# EasyEDA Pro project ProProject_2023新生开发板（小组）_2025-05-30.epro, board PCB1_3
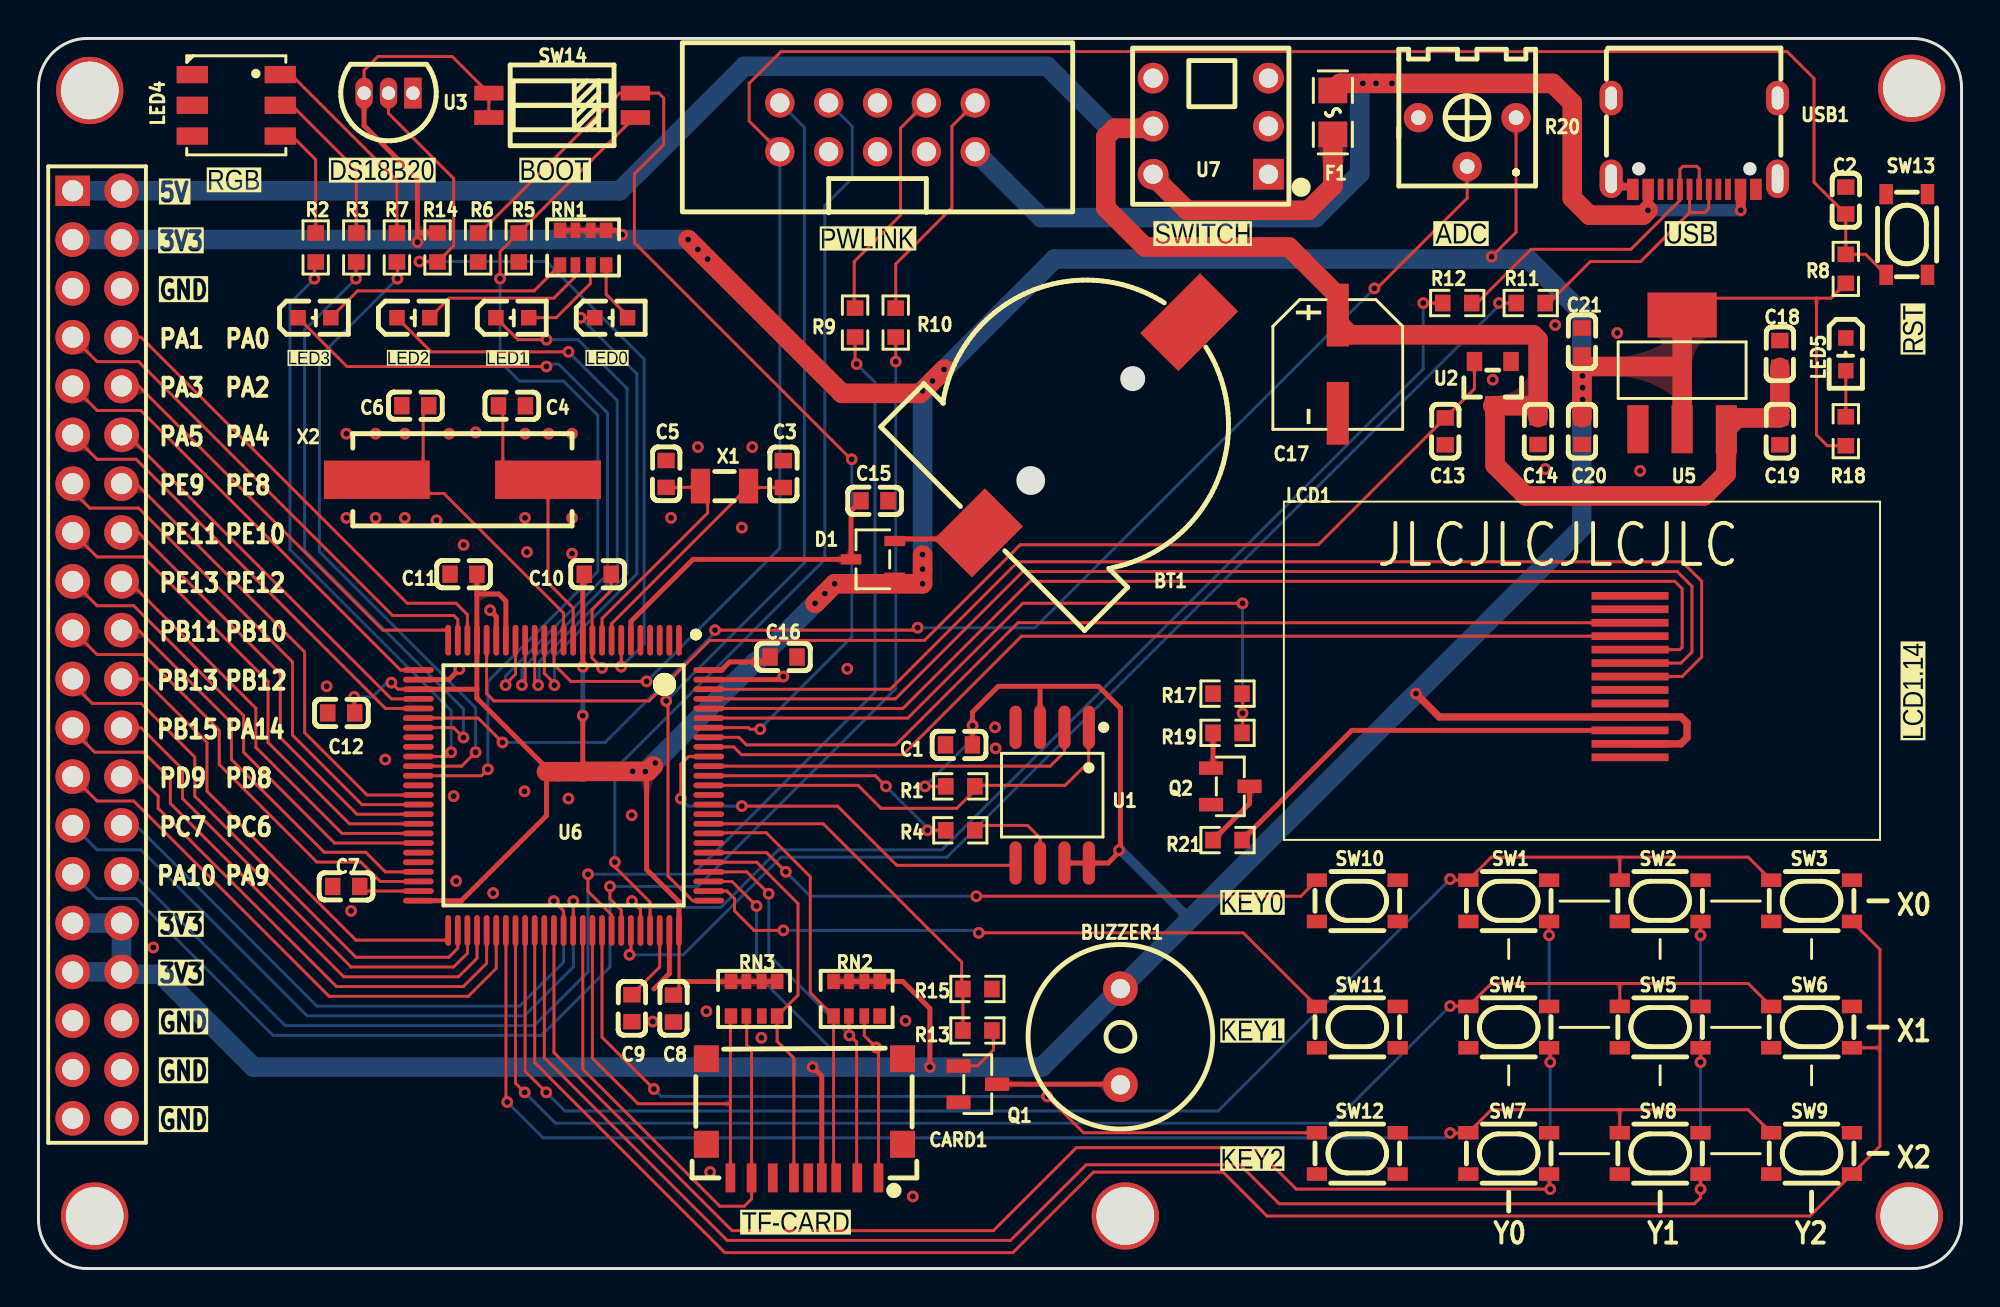
[diagram p2: board, top side]
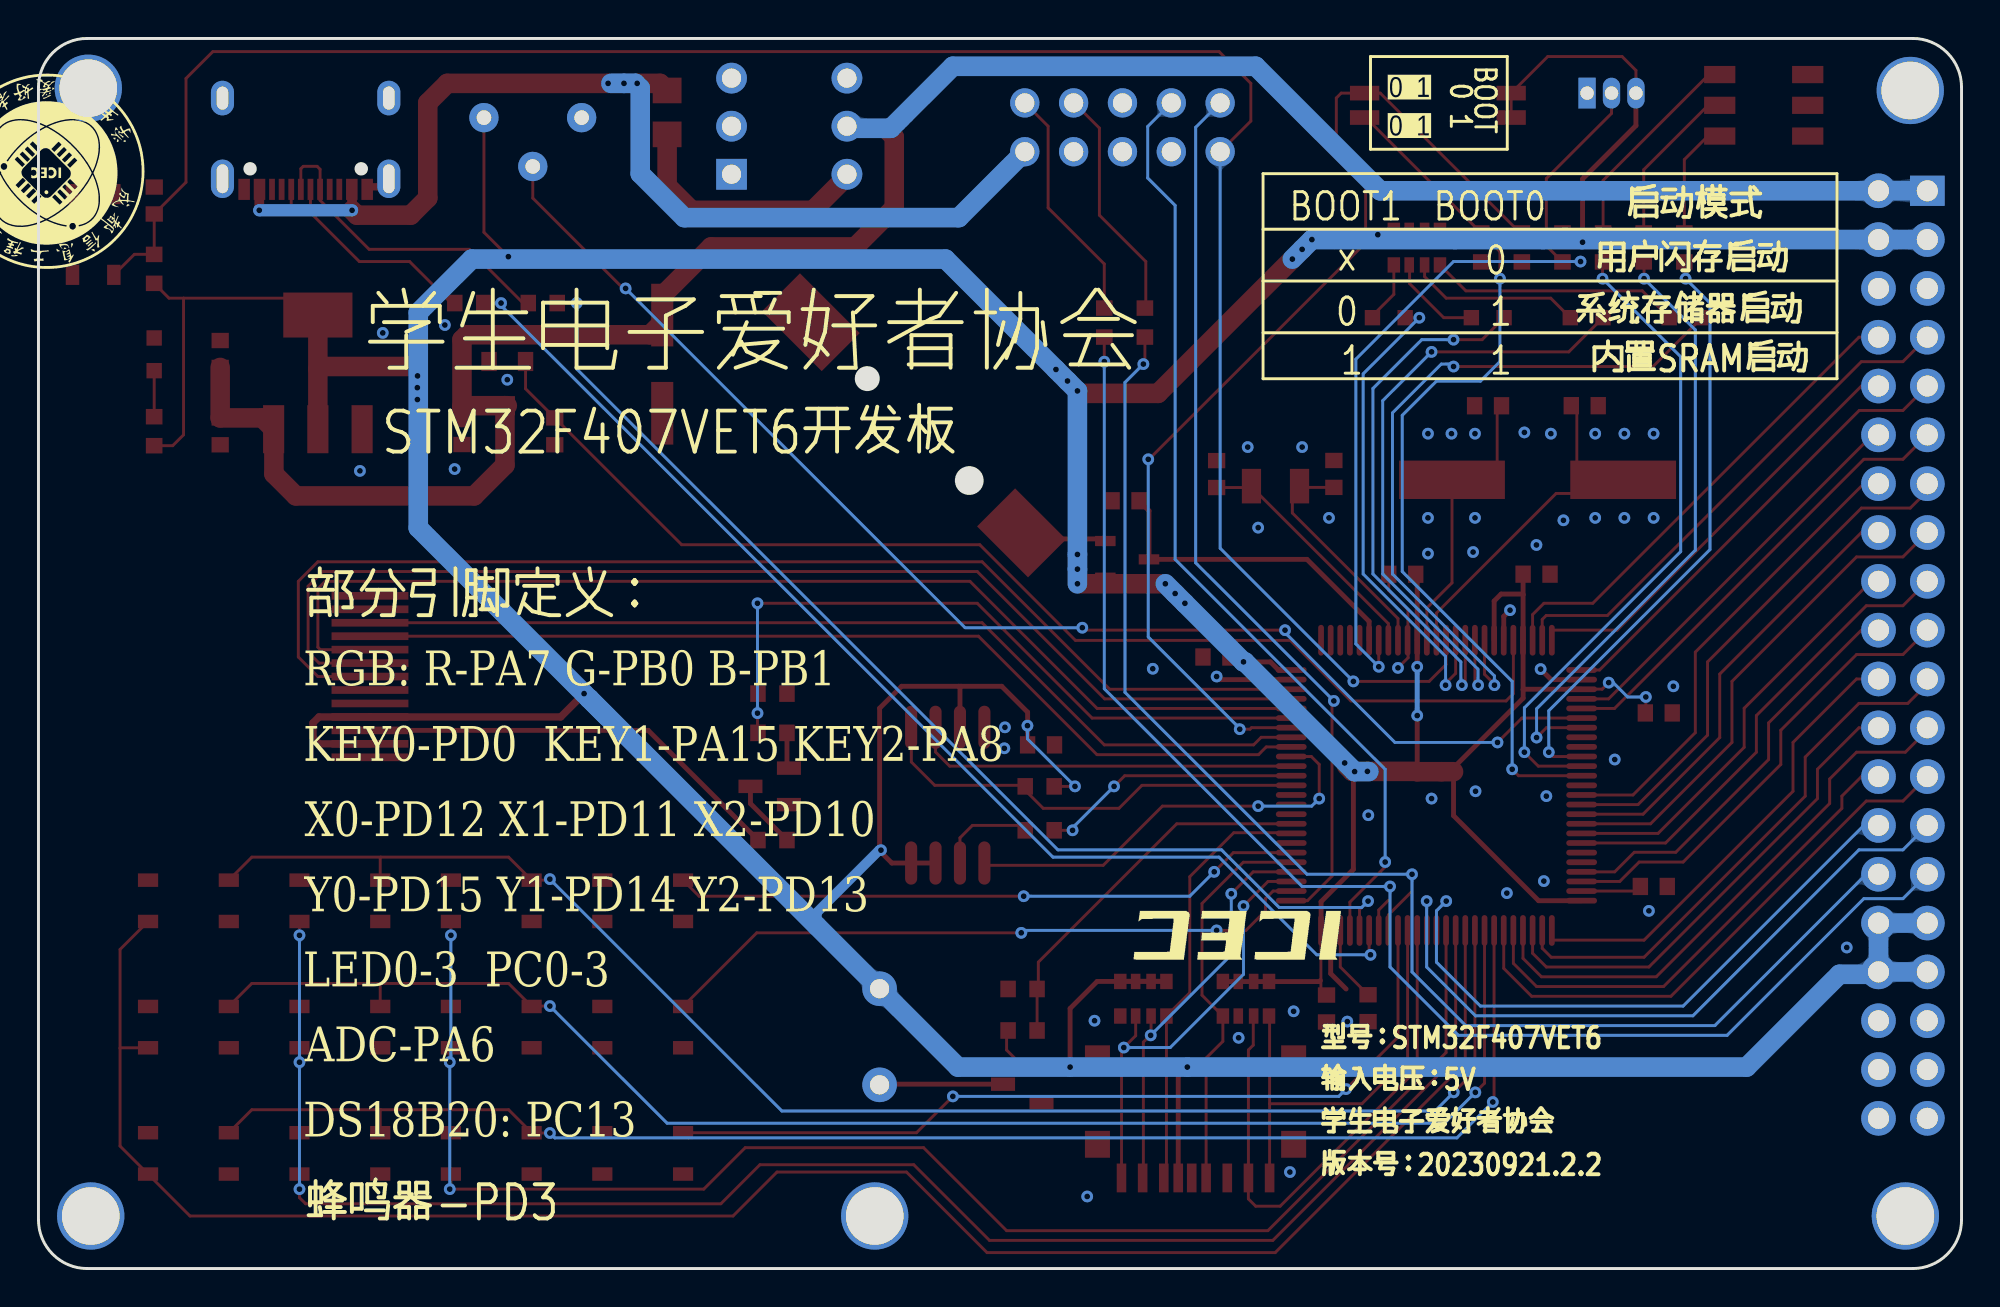
[diagram p3: board, bottom side, seen from below]

Outline 100 x 64 mm; copper layers: Top Layer, Bottom Layer. Coordinates in mm from the lower left corner of the outline.
Outline path: 0,61.46 0,2.54 arc(0.74,0.74) 2.54,0 97.46,0 arc(99.26,0.74) 100,2.54 100,61.46 arc(99.26,63.26) 97.46,64 2.54,64 arc(0.74,63.26) 0,61.46
Stack: Top Layer 0.035mm / Dielectric1 1.51mm FR4 er 4.5 / Bottom Layer 0.035mm

## Design rules (mm)
template: JLCPCB Capability(Two Layers Board)
spacing copperThickness1oz (default): track to track 0.102, other pairs 0.152 to 0.3
spacing copperThickness2oz: track to track 0.203, other pairs 0.152 to 0.3
track width copperThickness1oz (default): min 0.127, default 0.254, max 2.54
track width copperThickness2oz: min 0.203, default 0.254, max 2.54
differential pair differentialPair (default): width min 0.127, default 0.254, max 2.54; gap min 0.152, default 0.152
via viaSize (default): diameter min 0.5, default 0.61, max 10; hole min 0.3, default 0.305, max 6.3

## Placement (name value [footprint] x y rotation side)
BT1  BS-12-B3AA003  [BAT-SMD_BS-12-B3AA011]  54.36 43.76 225 top
BUZZER1  3000Hz  [BUZ-TH_BD9.6-P5.00-D0.7-FD]  56.26 12.06 270 top
C1  100nF  [C0603]  47.86 27.25 180 top
C2  100nF  [C0603]  93.98 55.57 270 top
C3  12pF  [C0603]  38.73 41.33 270 top
C4  20pF  [C0603]  24.62 44.89 0 top
C5  12pF  [C0603]  32.64 41.34 270 top
C6  20pF  [C0603]  19.59 44.89 180 top
C7  1uF  [C0603]  16 19.88 0 top
C8  100nF  [C0603]  33.02 13.53 270 top
C9  1uF  [C0603]  30.86 13.55 90 top
C10  100nF  [C0603]  29.08 36.12 0 top
C11  100nF  [C0603]  22.1 36.13 180 top
C12  100nF  [C0603]  15.74 28.91 180 top
C13  100nF  [C0603]  73.15 43.56 270 top
C14  1uF  [C0603]  77.98 43.57 90 top
C15  100nF  [C0603]  43.47 39.95 180 top
C16  100nF  [C0603]  38.75 31.82 0 top
C17  220uF  [CAP-SMD_BD6.3-L6.6-W6.6-LS7.2-R-RD]  67.56 47.05 90 top
C18  1uF  [C0603]  90.55 47.58 270 top
C19  100nF  [C0603]  90.55 43.56 270 top
C20  1uF  [C0603]  80.26 43.57 90 top
C21  100nF  [C0603]  80.26 48.23 90 top
CARD1  XKTF-0803-0  [TF-SMD_XKTF-0803-0]  39.83 7.81 0 top
D1  BAT54C  [SOT-23-3_L2.9-W1.4-P1.91-LS2.6-BR]  43.39 36.9 0 top
F1  BSMD0805-020-30V  [F0805]  67.31 60.15 90 top
H1  B-2100S40P-B110  [HDR-TH_40P-P2.54-V-M-R2-C20-S2.54]  3.05 31.94 270 top
LCD1  -  [1.14lcd]  80.46 30.8 270 top
LED0  NCD0603R3  [LED0603-R-RD_RED]  29.78 49.47 0 top
LED1  NCD0603R3  [LED0603-R-RD_RED]  24.64 49.47 0 top
LED2  NCD0603R3  [LED0603-R-RD_RED]  19.49 49.47 0 top
LED3  NCD0603R3  [LED0603-R-RD_RED]  14.35 49.47 0 top
LED4  MHP5050RGBDT  [LED-ARRAY-SMD_6P-L5.0-W5.0-TR-RD]  10.29 60.52 0 top
LED5  NCD0603R3  [LED0603-R-RD_RED]  93.98 47.57 270 top
NOREF  -  [Pad_e78]  97.41 61.41 0 top
NOREF#2  -  [Pad_e77]  97.28 2.73 0 top
NOREF#3  -  [Pad_e103]  56.52 2.73 0 top
NOREF#4  -  [Pad_e76]  2.92 2.73 0 top
NOREF#5  -  [Pad_e73]  2.67 61.29 0 top
P1  2.54-2*5P简牛  [IDC-TH_10P-P2.54_C5665]  43.63 59.38 0 top
Q1  SS8050  [SOT-23-3_L2.9-W1.3-P1.90-LS2.4-BR]  48.84 9.59 180 top
Q2  SS8050  [SOT-23-3_L2.9-W1.3-P1.90-LS2.4-BR]  61.98 25.09 180 top
R1  10kΩ  [R0603]  47.94 25.09 0 top
R2  220Ω  [R0603]  14.41 53.13 90 top
R3  220Ω  [R0603]  16.53 53.13 90 top
R4  20Ω  [R0603]  47.94 22.8 180 top
R5  10kΩ  [R0603]  24.98 53.13 270 top
R6  10kΩ  [R0603]  22.86 53.13 270 top
R7  470Ω  [R0603]  18.64 53.13 90 top
R8  10kΩ  [R0603]  93.98 52.01 90 top
R9  20Ω  [R0603]  42.46 49.22 270 top
R10  20Ω  [R0603]  44.58 49.22 90 top
R11  20Ω  [R0603]  77.6 50.23 0 top
R12  20Ω  [R0603]  73.78 50.23 0 top
R13  4.7kΩ  [R0603]  48.83 12.39 180 top
R14  10K  [R0603]  20.75 53.13 90 top
R15  10kΩ  [R0603]  48.83 14.55 180 top
R17  100kΩ  [R0603]  61.83 29.91 180 top
R18  470Ω  [R0603]  93.98 43.57 90 top
R19  1kΩ  [R0603]  61.83 27.87 180 top
R20  10kΩ  [RES-ADJ-TH_3362P]  74.3 58.61 180 top
R21  20Ω  [R0603]  61.83 22.29 180 top
RN1  470Ω  [RES-ARRAY-SMD_0603-8P-L3.2-W1.6-BL]  28.32 53.12 0 top
RN2  10kΩ  [RES-ARRAY-SMD_0603-8P-L3.2-W1.6-BL]  42.55 14.04 180 top
RN3  10kΩ  [RES-ARRAY-SMD_0603-8P-L3.2-W1.6-BL]  37.21 14.04 180 top
SW1  SKRPACE010  [KEY-SMD_4P-L4.2-W3.2-P2.20-LS4.6]  76.45 19.13 0 top
SW2  SKRPACE010  [KEY-SMD_4P-L4.2-W3.2-P2.20-LS4.6]  84.33 19.13 0 top
SW3  SKRPACE010  [KEY-SMD_4P-L4.2-W3.2-P2.20-LS4.6]  92.2 19.13 0 top
SW4  SKRPACE010  [KEY-SMD_4P-L4.2-W3.2-P2.20-LS4.6]  76.45 12.56 0 top
SW5  SKRPACE010  [KEY-SMD_4P-L4.2-W3.2-P2.20-LS4.6]  84.33 12.56 0 top
SW6  SKRPACE010  [KEY-SMD_4P-L4.2-W3.2-P2.20-LS4.6]  92.2 12.56 0 top
SW7  SKRPACE010  [KEY-SMD_4P-L4.2-W3.2-P2.20-LS4.6]  76.45 5.99 0 top
SW8  SKRPACE010  [KEY-SMD_4P-L4.2-W3.2-P2.20-LS4.6]  84.33 5.99 0 top
SW9  SKRPACE010  [KEY-SMD_4P-L4.2-W3.2-P2.20-LS4.6]  92.2 5.99 0 top
SW10  SKRPACE010  [KEY-SMD_4P-L4.2-W3.2-P2.20-LS4.6]  68.58 19.13 0 top
SW11  SKRPACE010  [KEY-SMD_4P-L4.2-W3.2-P2.20-LS4.6]  68.58 12.56 0 top
SW12  SKRPACE010  [KEY-SMD_4P-L4.2-W3.2-P2.20-LS4.6]  68.58 5.99 0 top
SW13  SKRPACE010  [KEY-SMD_4P-L4.2-W3.2-P2.20-LS4.6]  97.15 53.8 90 top
SW14  DSHP02TSGET  [SW-SMD_4P_DSHP02TSGET]  27.23 60.52 90 top
U1  W25Q16JVSSIQ  [SOIC-8_L5.3-W5.3-P1.27-LS8.0-BL]  52.72 24.63 180 top
U2  PJ75AL33SA  [SOT-23_L2.9-W1.3-P1.90-LS2.4-BR]  75.62 46.04 90 top
U3  DS18B20  [TO-92-3_L4.9-W3.7-P1.27-L]  18.2 61.15 180 top
U5  AMS1117-3.3  [SOT-223-3_L6.5-W3.4-P2.30-LS7.0-BR]  85.47 46.64 270 top
U6  STM32F407VET6  [LQFP-100_L14.0-W14.0-P0.50-LS16.0-BL]  27.3 25.14 180 top
U7  PB-22E08  [SW-TH_6P-L8.0-W8.0-P2.50_PB-22E08]  60.96 59.43 90 top
USB1  TYPE-C 16PIN 2MD(073)  [USB-C-SMD_TYPE-C-6PIN-2MD-073]  86.11 58.52 180 top
X1  32.768kHz  [FC-135R_L3.2-W1.5]  35.67 40.71 0 top
X2  8MHz  [CRYSTAL-SMD_L11.5-W4.8-LS12.7]  22.05 41.04 180 top

## Footprints (pads in the part's own frame, mm; a bottom-side part is the same pattern mirrored in y, then rotated)
1.14lcd
  custom 0.4x4 smd: 1(-4.199,2.3) 2(-3.498,2.3) 3(-2.799,2.3) 4(-2.099,2.3) 5(-1.399,2.3) 6(-0.699,2.3) 7(0.002,2.3) 8(0.702,2.3) 9(1.401,2.3) 10(2.102,2.3) 11(2.801,2.3) 12(3.502,2.3) 13(4.202,2.3)
BAT-SMD_BS-12-B3AA011
  rect 3.75x2.8 smd: 1(7.75,0)
  rect 4.4x2.8 smd: 2(-7.75,0)
BUZ-TH_BD9.6-P5.00-D0.7-FD
  round 1.8 hole 1: 1(-2.5,0) 2(2.5,0)
C0603
  rect 0.8x0.9 smd: 1(-0.7,0) 2(0.7,0)
CAP-SMD_BD6.3-L6.6-W6.6-LS7.2-R-RD
  rect 3.26x1.15 smd: 1(2.555,0) 2(-2.555,0)
CRYSTAL-SMD_L11.5-W4.8-LS12.7
  rect 5.5x2 smd: 1(-4.45,0) 2(4.45,0)
F0805
  rect 1.335x1.5 smd: 1(-1.143,0) 2(1.143,0)
FC-135R_L3.2-W1.5
  rect 1x1.8 smd: 1(-1.25,0) 2(1.25,0)
HDR-TH_40P-P2.54-V-M-R2-C20-S2.54
  rect 1.575x1.8 hole 1.1: 1(-24.13,-1.27)
  round 1.8 hole 1.1: 2(-24.13,1.27) 3(-21.59,-1.27) 4(-21.59,1.27) 5(-19.05,-1.27) 6(-19.05,1.27) 7(-16.51,-1.27) 8(-16.51,1.27) 9(-13.97,-1.27) 10(-13.97,1.27) 11(-11.43,-1.27) 12(-11.43,1.27) 13(-8.89,-1.27) 14(-8.89,1.27) 15(-6.35,-1.27) 16(-6.35,1.27) 17(-3.81,-1.27) 18(-3.81,1.27) 19(-1.27,-1.27) 20(-1.27,1.27) 21(1.27,-1.27) 22(1.27,1.27) 23(3.81,-1.27) 24(3.81,1.27) 25(6.35,-1.27) 26(6.35,1.27) 27(8.89,-1.27) 28(8.89,1.27) 29(11.43,-1.27) 30(11.43,1.27) 31(13.97,-1.27) 32(13.97,1.27) 33(16.51,-1.27) 34(16.51,1.27) 35(19.05,-1.27) 36(19.05,1.27) 37(21.59,-1.27) 38(21.59,1.27) 39(24.13,-1.27) 40(24.13,1.27)
IDC-TH_10P-P2.54_C5665
  round 1.524 hole 1: 1(-5.08,-1.27) 2(-5.08,1.27) 3(-2.54,-1.27) 4(-2.54,1.27) 5(0,-1.27) 6(0,1.27) 7(2.54,-1.27) 8(2.54,1.27) 9(5.08,-1.27) 10(5.08,1.27)
KEY-SMD_4P-L4.2-W3.2-P2.20-LS4.6
  rect 1.05x0.7 smd: 1(-2.1,1.075) 2(2.1,1.075) 3(-2.1,-1.075) 4(2.1,-1.075)
LED0603-R-RD_RED
  rect 0.8x0.8 smd: 1(0.851,0) 2(-0.851,0)
LED-ARRAY-SMD_6P-L5.0-W5.0-TR-RD
  rect 1.625x0.896 smd: 1(2.288,1.6) 2(-2.288,1.6) 3(2.288,0) 4(-2.288,0) 5(2.288,-1.6) 6(-2.288,-1.6)
LQFP-100_L14.0-W14.0-P0.50-LS16.0-BL
  oval 0.3x1.6 smd: 1(-6,-7.55) 2(-5.5,-7.55) 3(-5,-7.55) 4(-4.5,-7.55) 5(-4,-7.55) 6(-3.5,-7.55) 7(-3,-7.55) 8(-2.5,-7.55) 9(-2,-7.55) 10(-1.5,-7.55) 11(-1,-7.55) 12(-0.5,-7.55) 13(0,-7.55) 14(0.5,-7.55) 15(1,-7.55) 16(1.5,-7.55) 17(2,-7.55) 18(2.5,-7.55) 19(3,-7.55) 20(3.5,-7.55) 21(4,-7.55) 22(4.5,-7.55) 23(5,-7.55) 24(5.5,-7.55) 25(6,-7.55) 51(6,7.55) 52(5.5,7.55) 53(5,7.55) 54(4.5,7.55) 55(4,7.55) 56(3.5,7.55) 57(3,7.55) 58(2.5,7.55) 59(2,7.55) 60(1.5,7.55) 61(1,7.55) 62(0.5,7.55) 63(0,7.55) 64(-0.5,7.55) 65(-1,7.55) 66(-1.5,7.55) 67(-2,7.55) 68(-2.5,7.55) 69(-3,7.55) 70(-3.5,7.55) 71(-4,7.55) 72(-4.5,7.55) 73(-5,7.55) 74(-5.5,7.55) 75(-6,7.55)
  oval 1.6x0.3 smd: 26(7.55,-6) 27(7.55,-5.5) 28(7.55,-5) 29(7.55,-4.5) 30(7.55,-4) 31(7.55,-3.5) 32(7.55,-3) 33(7.55,-2.5) 34(7.55,-2) 35(7.55,-1.5) 36(7.55,-1) 37(7.55,-0.5) 38(7.55,0) 39(7.55,0.5) 40(7.55,1) 41(7.55,1.5) 42(7.55,2) 43(7.55,2.5) 44(7.55,3) 45(7.55,3.5) 46(7.55,4) 47(7.55,4.5) 48(7.55,5) 49(7.55,5.5) 50(7.55,6) 76(-7.55,6) 77(-7.55,5.5) 78(-7.55,5) 79(-7.55,4.5) 80(-7.55,4) 81(-7.55,3.5) 82(-7.55,3) 83(-7.55,2.5) 84(-7.55,2) 85(-7.55,1.5) 86(-7.55,1) 87(-7.55,0.5) 88(-7.55,0) 89(-7.55,-0.5) 90(-7.55,-1) 91(-7.55,-1.5) 92(-7.55,-2) 93(-7.55,-2.5) 94(-7.55,-3) 95(-7.55,-3.5) 96(-7.55,-4) 97(-7.55,-4.5) 98(-7.55,-5) 99(-7.55,-5.5) 100(-7.55,-6)
Pad_e73
  round 3.5 hole 3: NC(0,0)
Pad_e76
  round 3.5 hole 3: NC(0,0)
Pad_e77
  round 3.5 hole 3: NC(0,0)
Pad_e78
  round 3.5 hole 3: NC(0,0)
Pad_e103
  round 3.5 hole 3: NC(0,0)
R0603
  rect 0.806x0.864 smd: 1(-0.753,0) 2(0.753,0)
RES-ADJ-TH_3362P
  round 1.524 hole 0.762: 1(-2.54,-1.27) 2(0,1.27) 3(2.54,-1.27)
RES-ARRAY-SMD_0603-8P-L3.2-W1.6-BL
  rect 0.65x0.8 smd: 1(-1.2,-0.9) 4(1.2,-0.9) 5(1.2,0.9) 8(-1.2,0.9)
  rect 0.5x0.8 smd: 2(-0.4,-0.9) 3(0.4,-0.9) 6(0.4,0.9) 7(-0.4,0.9)
SOIC-8_L5.3-W5.3-P1.27-LS8.0-BL
  oval 0.63x2.25 smd: 1(-1.905,-3.53) 2(-0.635,-3.53) 3(0.635,-3.53) 4(1.905,-3.53) 5(1.905,3.53) 6(0.635,3.53) 7(-0.635,3.53) 8(-1.905,3.53)
SOT-23-3_L2.9-W1.3-P1.90-LS2.4-BR
  rect 1.25x0.7 smd: 1(1,-0.95) 2(1,0.95) 3(-1,0)
SOT-23-3_L2.9-W1.4-P1.91-LS2.6-BR
  rect 1.07x0.532 smd: 1(1.135,-0.955) 2(1.135,0.955) 3(-1.135,0)
SOT-23_L2.9-W1.3-P1.90-LS2.4-BR
  rect 1x0.8 smd: 1(1.15,-0.95) 2(1.15,0.95) 3(-1.15,0)
SOT-223-3_L6.5-W3.4-P2.30-LS7.0-BR
  rect 2.5x1.1 smd: 1(2.97,-2.3) 2(2.97,0) 3(2.97,2.3)
  rect 2.34x3.6 smd: 4(-2.97,0)
SW-SMD_4P_DSHP02TSGET
  rect 0.762x1.524 smd: 1(-0.635,-3.81) 2(0.635,-3.81) 3(0.635,3.81) 4(-0.635,3.81)
SW-TH_6P-L8.0-W8.0-P2.50_PB-22E08
  rect 1.6x1.6 hole 1: 1(-2.5,-3)
  round 1.6 hole 1: 2(0,-3) 3(2.5,-3) 4(-2.5,3) 5(0,3) 6(2.5,3)
TF-SMD_XKTF-0803-0
  rect 0.5x1.5 smd: 1(3.85,-3.1) 2(2.75,-3.1) 3(1.65,-3.1) 4(0.9,-3.1) 5(-0.55,-3.1) 6(-1.65,-3.1) 7(-2.75,-3.1) 8(-3.85,-3.1) 9(0.2,-3.1)
  rect 1.3x1.4 smd: 10(-5.1,-1.35) 11(-5.1,3.1) 12(5.1,3.1) 13(5.1,-1.35)
TO-92-3_L4.9-W3.7-P1.27-L
  rect 0.9x1.6 hole 0.7: 1(-1.27,0)
  oval 0.9x1.6 hole 0.7: 2(0,0) 3(1.27,0)
USB-C-SMD_TYPE-C-6PIN-2MD-073
  rect 0.6x1.1 smd: 1(-3.2,2.375) 2(-2.4,2.375) 11(2.4,2.375) 12(3.2,2.375)
  rect 0.3x1.1 smd: 3(-1.75,2.375) 4(-1.25,2.375) 5(-0.75,2.375) 6(-0.25,2.375) 7(0.25,2.375) 8(0.75,2.375) 9(1.25,2.375) 10(1.75,2.375)
  oval 1.2x2 hole 0.6x1.5: 13(-4.325,1.825) 14(4.325,1.825)
  oval 1.2x1.8 hole 0.6x1.2: 13(-4.325,-2.375) 14(4.325,-2.375)

## Nets
As in the schematic.

Pads without a net: CARD1 9; LCD1 1 2 9; NOREF NC; NOREF#2 NC; NOREF#3 NC; NOREF#4 NC; NOREF#5 NC; P1 3 7; RN2 8; RN3 7; SW1 2 3; SW2 2 3; SW3 2 3; SW4 2 3; SW5 2 3; SW6 2 3; SW7 2 3; SW8 2 3; SW9 2 3; SW10 2 3; SW11 2 3; SW12 2 3; SW13 2 3; U6 1 2 3 4 5 33 34 38 45 46 82 85 86 87; U7 1 2 3 6; USB1 3 4 9 10

## Via types
v1: diameter 0.61, hole 0.305, Top Layer to Bottom Layer, 151 vias

## Routing (per net, layer and track width the routed paths; a pad name or vN(x,y) marks a point on that pad's centre or on a via; arc(x,y) is an arc through that point)
3V3: length 441.9
  Top Layer w0.152: U6.11 28.3,35.23 ; U5.4 86.35,50.49 92.46,50.49 ; 92.46,50.49 92.46,43.37 93.02,42.81 R18.1 ; 92.46,50.49 93.21,50.49 R8.1 ; v1(16.42,29.74) 16.42,29.26 16.32,29.16 ; U3.3 16.93,62.34 17.65,63.06 21.52,63.06 SW14.3 SW14.4 ; v1(18.35,30.48) 18.69,30.14 19.48,30.14 19.52,30.1 ; 33.27,17.21 33.31,17.17 33.31,14.52 C8.1 ; v1(75.56,52.65) 76.83,53.92 76.83,59.76 ; R1.1 v1(46.1,25.09)
  Top Layer w0.254: U1.7 U1.8 55.63,21.1 56.26,21.73 56.26,29.15 55.12,30.29 52.14,30.29 ; 22.8,32.7 U6.22 ; 22.8,32.7 22.8,30.14 22.76,30.14 ; 22.8,32.7 22.8,35.06 ; 27.05,25.85 27.18,25.72 28.3,25.72 v1(28.3,28.77) ; U1.3 52.08,30.23 ; 52.08,30.23 52.14,30.29 ; 52.08,30.23 52.08,30.24 52.03,30.29 ; 22.76,30.14 22.8,30.1 22.8,29.67 26.42,26.05 26.42,23.56 21.99,19.14 U6.50 ; 22.76,30.14 U6.28 ; v1(30.35,53.79) 30.13,54.02 RN1.5 RN1.7 RN1.8 ; 38.57,14.93 33.39,14.93 33.34,14.99 ; 52.14,30.29 52.03,30.29 ; v1(40.26,10.48) 40.73,10.01 CARD1.4 40.8,4.64 40.8,4.42 ; 41.42,14.95 43.81,14.95 43.83,14.96 ; 22.8,35.06 22.83,35.09 23.94,35.09 24.3,34.73 U6.19 ; 22.8,35.06 C11.1 ; U6.75 33.3,19.09 31.62,20.77 31.62,25.68 31.52,25.78 ; 52.03,30.29 49.91,30.29 48.56,28.95 C1.1 ; C16.1 37.79,31.56 v1(37.34,31.56) 35.94,31.56 35.52,31.14 35.22,31.14 ; v1(19.71,53.4) 19.71,53.89 ; 19.71,53.89 19.71,56.69 16.93,59.46 U3.3 ; 19.71,53.89 19.72,53.88 R14.2 ; v1(46.36,10.48) 46.36,13.53 44.95,14.94 RN2.1 RN2.2 RN2.3 41.34,14.94 ; C10.1 28.3,36.04 U6.11 v1(28.3,31.31)
  Top Layer w0.381: v1(71.63,29.91) 72.84,28.7 LCD1.10 85.41,28.7 85.73,28.39 85.73,27.63 85.4,27.3 LCD1.12
  Top Layer w1.016: U5.2 85.47,46.81 ; 85.47,46.81 U5.4 ; 85.47,46.81 85.35,46.93 80.3,46.93 80.26,46.9 C20.2 ; 26.42,25.85 28.3,25.85 28.32,25.87 v1(30.89,25.87) 31.69,25.87 31.97,26.15 ; v1(33.78,53.53) v1(34.29,53.03) v1(34.8,52.52) 41.78,45.53 45.85,45.53 v1(46.49,46.18) 47.12,46.8 ; 45.97,37.12 v1(45.97,36.39) v1(45.97,35.63) v1(41.4,35.63) v1(40.89,35.12) v1(40.39,34.61)
  Bottom Layer w0.152: v1(18.35,30.48) 18.11,30.48 17.36,29.74 v1(16.42,29.74) ; 21.82,53.41 21.76,53.46 21.76,53.53 ; v1(46.1,25.09) 48.57,27.56 v1(48.57,28.25)
  Bottom Layer w0.254: v1(19.71,53.4) 19.72,53.42 19.72,53.53 ; v1(30.35,53.79) 26.58,53.79 26.33,53.53 ; 70.43,28.71 70.44,28.7 70.48,28.7 ; v1(28.3,28.77) v1(28.3,31.31)
  Bottom Layer w0.508: 59.53,17.82 59.53,18.52 56.28,21.77 v1(56.19,21.77)
  Bottom Layer w1.016: v1(45.97,35.63) v1(45.97,36.39) v1(45.97,37.15) v1(45.97,45.66) v1(46.49,46.18) v1(47.09,46.78) 52.83,52.52 77.47,52.52 80.25,49.74 80.25,38.53 v1(71.63,29.91) 71.37,29.65 ; 71.37,29.65 70.43,28.71 ; 71.37,29.65 71.36,29.65 BUZZER1.1 52.18,10.48 v1(46.36,10.48) v1(40.26,10.48) 11.18,10.48 6.35,15.31 4.44,15.31 H1.34 ; H1.34 H1.32 H1.31 ; H1.34 H1.33 ; v1(34.8,52.52) v1(34.29,53.03) v1(33.78,53.53) H1.4 H1.3 ; 30.82,25.86 v1(31.56,25.86) 37.27,31.56 v1(37.34,31.56) v1(40.39,34.61) v1(40.89,35.12) v1(41.4,35.63)
  vias: v1(32.08,26.3) v1(80.29,46.44) v1(80.3,45.83) v1(80.3,45.21)
+5V: length 123.3
  Top Layer w1.016: 75.74,44.89 77.94,44.89 77.98,44.85 ; 75.74,44.89 U2.3 ; 75.74,44.89 75.74,41.8 77.34,40.2 86.61,40.2 87.76,41.34 87.76,43.66 U5.3 88.36,44.26 C19.1 C18.2 ; 77.98,44.85 77.98,48.33 77.72,48.58 68.2,48.58 67.56,49.22 C17.1 67.56,50.61 65.02,53.15 57.53,53.15 55.5,55.19 55.5,58.87 55.96,59.33 57.96,59.33 ; 77.98,44.85 C14.2
  Bottom Layer w1.016: H1.1 H1.2 30.23,56.07 36.7,62.55 52.45,62.55 55.68,59.33 57.96,59.33
GND: length 17.3
  Top Layer w0.152: 20.1,30.64 U6.27 ; 28.78,32.29 28.78,31.78 v1(29.3,31.25) ; 29.78,35.88 29.78,35.27 28.79,34.28 28.79,32.99
  Top Layer w0.254: v1(38.73,30.8) 38.57,30.64 U6.99 ; U6.74 32.8,15.35 32,14.55 ; U6.20 23.8,33.93 v1(23.48,34.25) ; v1(21.89,31.19) 21.34,30.64 20.1,30.64
  Top Layer w0.381: 81.78,56.83 82.33,56.28 82.91,56.28
  vias: v1(5.97,16.7) v1(14.99,30.29) v1(16.01,43.44) v1(16.01,39.06) v1(16.26,18.61) v1(17.53,43.44) v1(17.53,39.06) v1(18.03,26.48) v1(19.05,43.44) v1(19.05,39.06) v1(20.7,38.93) v1(21.35,43.44) v1(21.59,24.58) v1(21.72,20.16) v1(22.11,37.65) v1(22.73,43.5) v1(23.64,19.53) v1(25.3,43.44) v1(25.3,39.06) v1(25.27,24.83) v1(25.4,37.28) v1(26.52,43.44) v1(27.56,24.45) v1(27.75,43.44) v1(27.75,39.06) v1(27.75,37.2) v1(30.85,23.59) v1(31.94,12.85) v1(32.89,39.06) v1(34.29,42.74) v1(34.73,13.38) v1(34.92,5.02) v1(36.58,38.55) v1(37.12,42.74) v1(37.59,12.01) v1(42.06,31.21) v1(45.08,12.89) v1(45.47,3.75) v1(49.74,28.16) v1(49.77,27.07) v1(75.62,46.24) v1(78.36,41.6) v1(78.87,49.09) v1(82.1,48.68) v1(83.28,41.5)
VBAT: length 17
  Top Layer w0.254: C15.2 42.25,39.43 D1.3 34.04,36.9 30.8,33.67 U6.6
VIN: length 58.1
  Top Layer w0.508: 88.51,56.28 88.52,56.27 v1(88.52,55.06) ; 83.71,56.28 83.69,56.27 v1(83.69,55.06)
  Top Layer w1.016: F1.2 67.68,61.66 v1(68.87,61.66) v1(69.55,61.66) v1(70.38,61.66) 78.74,61.66 79.76,60.65 79.76,55.69 80.64,54.8 83.44,54.8 v1(83.69,55.06)
  Bottom Layer w0.635: v1(88.52,55.06) v1(83.69,55.06)
  Bottom Layer w1.016: P1.9 52.14,54.68 66.42,54.68 68.71,56.96 68.71,61.41 68.96,61.66 v1(69.55,61.66) 70.23,61.66
ADC_RES: length 68.8
  Top Layer w0.152: v1(45.72,33.34) 45.59,33.21 v1(35.18,33.21) ; 74.3,57.59 74.3,55.69 69.6,50.99 v1(69.47,50.99) ; v1(24.13,27.37) 22.86,28.64 U6.31
  Bottom Layer w0.152: v1(69.47,50.99) 51.82,33.34 v1(45.72,33.34) ; v1(24.13,27.37) 29.46,27.37 35.18,33.09 v1(35.18,33.21)
BOOT0: length 55.6
  Top Layer w0.152: v1(42.29,42.1) 42.25,42.1 30.99,53.37 30.99,56.96 32.51,58.49 32.51,60.9 32.26,61.15 SW14.2 30.23,61.15 22.95,53.88 R6.1 ; v1(37.53,28.06) 37,28.06 36.92,28.14 U6.94
  Bottom Layer w0.152: v1(37.53,28.06) 37.53,28.1 42.29,32.86 v1(42.29,42.1)
BOOT1: length 46.4
  Top Layer w0.152: U6.37 23.03,25.64 v1(23.37,25.98) ; v1(24,51.5) 24,52.91 R5.1 30.98,59.88 SW14.1
  Bottom Layer w0.152: v1(24,51.5) 24,47.18 25.02,46.17 27.3,46.17 29.08,44.39 29.08,36.26 23.37,30.55 v1(23.37,25.98)
BUZZER: length 19.7
  Top Layer w0.152: U6.84 40.81,23.14 48.01,15.94 48.01,14.61 R15.2 R13.2
DS18B20: length 43.1
  Top Layer w0.152: U6.7 v1(30.3,31.31) ; v1(19.81,52.39) 20.73,52.39 R14.1 21.59,53.21 21.59,56.71 18.2,60.1 U3.2
  Bottom Layer w0.152: v1(30.3,31.31) 31.5,32.5 31.5,47.31 26.42,52.39 v1(19.81,52.39)
FLASH_CS: length 23.1
  Top Layer w0.152: U6.88 42.62,25.14 43.81,23.94 47.75,23.94 48.95,25.14 53.39,25.14 54.61,26.36 54.61,28.15 U1.1
KEY0: length 32.9
  Top Layer w0.152: v1(48.77,19.37) 65.64,19.37 SW10.1 ; U6.81 37.86,21.64 v1(38.86,20.64)
  Bottom Layer w0.152: v1(38.86,20.64) 40.13,19.37 v1(48.77,19.37)
KEY1: length 34.5
  Top Layer w0.152: SW11.1 62.65,17.47 v1(48.89,17.47) ; v1(38.73,17.59) 37.21,17.59 36.2,18.61 36.2,19.24 35.8,19.64 U6.77
  Bottom Layer w0.152: v1(48.89,17.47) 48.77,17.59 v1(38.73,17.59)
KEY2: length 45.2
  Top Layer w0.152: v1(32,9.34) 29.3,12.04 U6.67 ; 66.21,6.8 SW12.1 54.34,7.07 v1(52.45,8.96)
  Bottom Layer w0.152: v1(52.45,8.96) 32.39,8.96 v1(32,9.34)
KEY_X0: length 80.2
  Top Layer w0.152: 82.2,21.4 88.91,21.4 SW3.1 ; 82.2,21.4 75.55,21.4 SW1.1 73.46,20.21 v1(73.41,20.26) ; 82.2,21.4 82.23,21.38 SW2.1 ; U6.59 25.3,10.27 v1(26.4,9.17)
  Bottom Layer w0.152: v1(26.4,9.17) 27.38,8.2 61.34,8.2 v1(73.41,20.26)
KEY_X1: length 78.8
  Top Layer w0.152: SW6.1 88.91,14.83 82.2,14.83 ; 82.2,14.83 75.55,14.83 SW4.1 74.33,13.66 v1(73.41,13.66) ; 82.2,14.83 82.23,14.81 SW5.1 ; v1(25.28,9.17) 24.8,9.64 U6.58
  Bottom Layer w0.152: v1(25.28,9.17) 26.89,7.56 67.31,7.56 v1(73.41,13.66)
KEY_X2: length 77.8
  Top Layer w0.152: v1(24.38,8.66) 24.31,8.73 24.31,17.59 U6.57 ; 82.2,8.26 88.91,8.26 SW9.1 ; 82.2,8.26 75.55,8.26 SW7.1 74.34,7.05 v1(73.41,7.05) ; 82.2,8.26 82.23,8.24 SW8.1
  Bottom Layer w0.152: v1(73.41,7.05) 73.15,6.8 26.24,6.8 v1(24.38,8.66)
KEY_Y0: length 80.2
  Top Layer w0.152: SW1.4 v1(78.55,17.34) ; v1(78.61,10.74) 78.61,11.43 78.55,11.49 ; U6.62 26.8,11.24 36.07,1.97 49.66,1.97 53.98,6.29 63.25,6.29 65.4,4.13 v1(78.61,4.13) 78.55,4.19 SW7.4
  Bottom Layer w0.152: v1(78.61,4.13) v1(78.61,10.74) 78.55,10.79 v1(78.55,17.34)
KEY_Y1: length 89.2
  Top Layer w0.152: U6.61 26.3,10.97 35.81,1.46 50.55,1.46 54.48,5.4 62.48,5.4 64.52,3.37 86.11,3.37 86.43,3.69 v1(86.43,4.13) SW8.4 ; SW2.4 v1(86.43,17.34) ; v1(86.43,10.74) 86.43,11.49
  Bottom Layer w0.152: v1(86.43,17.34) v1(86.43,10.74) v1(86.43,4.13)
KEY_Y2: length 98.9
  Top Layer w0.152: 95.76,11.47 95.74,11.49 94.3,11.49 ; 95.76,11.47 95.76,16.6 SW3.4 ; 95.76,11.47 95.76,6.37 SW9.4 92.12,2.73 63.88,2.73 61.59,5.02 54.86,5.02 50.67,0.83 35.69,0.83 25.8,10.71 U6.60
LCD_BLK: length 38
  Top Layer w0.152: R19.1 62.61,27.9 v1(62.61,28.9) 62.61,29.89 R17.1 ; v1(62.61,34.61) 51.18,34.61 45.21,28.64 U6.95
  Bottom Layer w0.152: v1(62.61,34.61) v1(62.61,28.9)
LCD_CS: length 62.9
  Top Layer w0.152: LCD1.7 85.47,30.8 86.49,31.82 86.49,35.75 85.47,36.77 50.93,36.77 44.3,30.14 U6.98
LCD_RES: length 61.1
  Top Layer w0.152: LCD1.6 85.41,31.5 85.98,32.07 85.98,35.5 85.22,36.26 51.18,36.26 44.56,29.64 U6.97
LCD_RS: length 59.3
  Top Layer w0.152: U6.96 44.95,29.14 51.56,35.75 85.09,35.75 85.47,35.37 85.47,32.33 85.34,32.2 LCD1.5
LCD_SCL: length 50.6
  Top Layer w0.152: LCD1.4 51.12,32.9 44.96,26.74 36.56,26.74 36.15,27.14 U6.92
LCD_SDA: length 50.7
  Top Layer w0.152: LCD1.3 50.93,33.6 44.58,27.25 36.81,27.25 36.42,27.64 U6.93
LED0: length 25.4
  Top Layer w0.152: v1(26.83,30.35) 26.83,30.44 26.3,30.97 U6.15 ; v1(28.19,49.47) LED0.2
  Bottom Layer w0.152: v1(28.19,49.47) 31.11,46.55 31.11,36.14 26.83,31.85 v1(26.83,30.35)
LED1: length 28.3
  Top Layer w0.152: 26.03,30.19 25.8,30.42 U6.16 ; v1(26.42,48.33) 24.93,48.33 LED1.2
  Bottom Layer w0.152: v1(26.42,48.33) 28.07,48.33 30.61,45.79 30.61,36.14 26.03,31.56 26.03,30.29
  vias: v1(25.98,30.35)
LED2: length 32.6
  Top Layer w0.152: U6.17 25.3,30.45 25.15,30.29 ; v1(27.56,47.69) 20.42,47.69 LED2.2
  Bottom Layer w0.152: v1(27.56,47.69) 30.1,45.15 30.1,36.14 25.15,31.18 25.15,30.29
  vias: v1(25.14,30.35)
LED3: length 37.2
  Top Layer w0.152: v1(26.42,46.93) 16.04,46.93 LED3.2 ; v1(24.29,30.35) 24.29,30.4 24.8,30.92 U6.18
  Bottom Layer w0.152: v1(24.29,30.35) 24.29,30.83 29.59,36.14 29.59,44.52 27.05,47.06 26.54,47.06 v1(26.42,46.93)
NRST: length 110.1
  Top Layer w0.152: SW13.1 95.01,52.77 93.98,52.77 ; U6.14 26.8,31.43 27.69,30.55 v1(31.62,30.55) ; 93.98,52.77 R8.2 ; 93.98,52.77 C2.2 92.33,56.52 92.33,61.92 90.93,63.31 38.61,63.31 36.96,61.66 36.96,59.7 P1.1
  Bottom Layer w0.152: v1(31.62,30.55) 38.55,37.48 P1.1
PA0: length 25.3
  Top Layer w0.152: U6.23 22.3,34.02 21.72,34.61 19.18,34.61 5.33,48.45 H1.8
PA1: length 27.2
  Top Layer w0.152: U6.24 21.8,33.77 21.6,33.98 18.41,33.98 5.21,47.18 3.05,47.18 H1.7
PA2: length 22.8
  Top Layer w0.152: H1.10 5.21,45.91 17.91,33.21 21.3,33.21 U6.25
PA3: length 24.1
  Top Layer w0.152: U6.26 18.82,31.14 5.32,44.64 3.05,44.64 H1.9
PA4: length 21.1
  Top Layer w0.152: H1.12 4.62,43.37 18.35,29.64 U6.29
PA5: length 23.9
  Top Layer w0.152: H1.11 3.05,42.1 5.08,42.1 18.05,29.14 U6.30
PA7: length 31.8
  Top Layer w0.152: R3.1 16.51,52.35 v1(16.51,51.5) ; U6.32 21.58,28.14 v1(22.1,27.63)
  Bottom Layer w0.152: v1(22.1,27.63) 22.1,29.12 13.84,37.37 13.84,48.84 v1(16.51,51.5)
PA9: length 75
  Top Layer w0.152: v1(28.57,20.51) 28.57,19.63 29.8,18.4 U6.68 ; R9.2 42.46,47.14 v1(42.55,47.06)
  Bottom Layer w0.152: v1(42.55,47.06) 43.5,46.1 43.5,29.98 34.04,20.51 v1(28.57,20.51) 28.57,15.43 25.78,12.64 12.83,12.64 4.95,20.51 H1.30
PA10: length 77
  Top Layer w0.152: R10.1 v1(44.58,47.18) ; v1(29.72,19.88) 29.72,19.24 30.3,18.65 U6.69
  Bottom Layer w0.152: v1(44.58,47.18) 44.58,30.17 34.29,19.88 v1(29.72,19.88) 29.72,15.69 26.16,12.13 12.19,12.13 5.08,19.24 3.05,19.24 H1.29
PA11: length 61.6
  Top Layer w0.152: 76.84,50.04 76.65,50.23 v1(75.95,50.23) ; U6.70 30.8,16.39 v1(30.73,16.32)
  Bottom Layer w0.152: v1(30.73,16.32) 33.53,16.32 38.61,21.4 47.24,21.4 75.95,50.11 v1(75.95,50.23)
PA12: length 59.1
  Top Layer w0.152: U6.71 31.3,18.67 v1(30.86,19.12) ; 73.02,49.98 72.77,50.23 v1(72.01,50.23)
  Bottom Layer w0.152: v1(72.01,50.23) 72.01,46.8 46.99,21.78 38.48,21.78 35.48,18.79 31.19,18.79 v1(30.86,19.12)
PA13: length 49.4
  Top Layer w0.152: v1(29.97,21.15) 29.97,20.9 31.8,19.06 U6.72
  Bottom Layer w0.152: v1(29.97,21.15) 29.97,25.98 40.89,36.9 40.89,55.31 42.32,56.74 42.32,59.42 41.09,60.65
PA14: length 46.4
  Top Layer w0.152: U6.76 34.01,19.14 32.74,20.42 32.74,29.44 v1(32.64,29.53)
  Bottom Layer w0.152: 38.55,60.65 39.83,59.37 39.83,36.72 v1(32.64,29.53)
PB0: length 31.3
  Top Layer w0.152: U6.35 21.24,26.64 v1(21.46,26.86) ; R2.1 14.35,52.31 v1(14.35,51.5)
  Bottom Layer w0.152: v1(21.46,26.86) 21.46,29.02 13.08,37.41 13.08,50.23 v1(14.35,51.5)
PB1: length 33.8
  Top Layer w0.152: v1(22.73,26.86) 22.01,26.14 U6.36 ; v1(18.67,51.5) 18.67,52.34 R7.1
  Bottom Layer w0.152: v1(18.67,51.5) 14.6,47.44 14.6,37.3 22.73,29.17 v1(22.73,26.86)
PB3: length 13.7
  Top Layer w0.152: v1(44.07,25.09) 43.52,25.64 U6.89 ; v1(46.23,22.8) 46.93,22.8 47.18,22.55
  Bottom Layer w0.152: v1(46.23,22.8) 46.23,22.93 v1(44.07,25.09)
PB4: length 20.1
  Top Layer w0.152: U1.2 53.35,26.88 52.61,26.14 U6.90
PB5: length 22.4
  Top Layer w0.152: 50.91,20.98 44.63,20.98 41.55,24.06 v1(36.58,24.06) ; U6.91 33.81,26.64 33.4,26.23 v1(33.4,24.45)
  Bottom Layer w0.152: v1(36.58,24.06) 33.79,24.06 v1(33.4,24.45)
PB10: length 21.8
  Top Layer w0.152: U6.47 18.04,20.64 17.02,21.66 14.86,21.66 10.03,26.48 10.03,28.39 5.21,33.21 H1.20
PB11: length 24.4
  Top Layer w0.152: H1.19 3.05,31.94 5.46,31.94 9.4,28.01 9.4,26.23 14.48,21.15 16.76,21.15 17.77,20.14 U6.48
PB12: length 24.6
  Top Layer w0.152: U6.51 21.3,17.12 21.28,17.09 16.51,17.09 8.76,24.83 8.76,27.37 5.46,30.67 H1.22
PB13: length 28.5
  Top Layer w0.152: H1.21 1.78,30.42 2.79,29.4 5.33,29.4 8.13,26.61 8.13,24.58 16.51,16.2 21.34,16.2 21.8,16.67 U6.52
PB14: length 25.6
  Top Layer w0.152: U6.53 22.3,16.4 21.59,15.69 16.26,15.69 7.49,24.45 7.49,25.98 5.33,28.13 H1.24 4.32,28.01
PB15: length 29.1
  Top Layer w0.152: H1.23 1.78,28.01 2.92,26.86 5.46,26.86 6.86,25.47 6.86,24.2 15.88,15.18 21.84,15.18 22.8,16.14 U6.54
PC6: length 33
  Top Layer w0.152: v1(26.8,19.12) 27.3,18.61 U6.63
  Bottom Layer w0.152: v1(26.8,19.12) 27.3,18.61 U6.63 27.3,15.94 25.02,13.66 14.48,13.66 5.08,23.05 H1.28
PC7: length 36.2
  Top Layer w0.152: v1(27.81,19.12) 27.81,17.6 U6.64
  Bottom Layer w0.152: v1(27.81,19.12) 27.81,15.69 25.27,13.15 13.97,13.15 5.33,21.78 3.05,21.78 H1.27
PC8: length 28.7
  Top Layer w0.152: RN3.6 36.83,13.12 36.83,11.62 37.08,11.37 CARD1.7 37.08,4.71 37.08,3.62 36.7,3.24 35.43,3.24 28.3,10.37 U6.65
PC9: length 23.2
  Top Layer w0.152: CARD1.8 35.98,8.58 ; 35.98,8.58 31.18,8.58 28.8,10.95 U6.66 ; 35.98,8.58 35.98,13.11 RN3.5
PC10: length 23.1
  Top Layer w0.152: CARD1.1 43.68,11.38 42.95,12.11 RN2.7 ; U6.78 36.06,20.14 v1(37.34,18.86)
  Bottom Layer w0.152: v1(37.34,18.86) 37.34,15.31 41.15,11.5 v1(43.56,11.5)
PC11: length 21.4
  Top Layer w0.152: 42.14,12.18 42.55,11.78 42.55,4.75 CARD1.2 ; 42.14,12.18 42.14,12.15 v1(42.16,12.13) ; 42.14,12.18 RN2.6 ; U6.79 36.83,20.64 v1(37.97,19.5)
  Bottom Layer w0.152: v1(42.16,12.13) 37.97,16.32 v1(37.97,19.5)
PC12: length 20.6
  Top Layer w0.152: U6.80 37.35,21.14 39.5,18.99 39.5,14.22 RN3.8 38.41,11.82 39.28,10.95 CARD1.5
PD2: length 22.5
  Top Layer w0.152: U6.83 34.89,22.67 37.85,22.67 40.13,20.39 40.13,14.35 41.34,13.14 41.34,4.85 CARD1.3
PD8: length 26.1
  Top Layer w0.152: H1.26 5.21,25.59 6.22,24.58 6.22,23.94 15.49,14.67 22.1,14.67 23.3,15.88 U6.55
PD9: length 29.3
  Top Layer w0.152: H1.25 3.05,24.32 4.95,24.32 15.11,14.16 22.35,14.16 23.8,15.62 U6.56
PE8: length 24.6
  Top Layer w0.152: H1.14 5.08,40.83 13.84,32.07 13.84,27.88 17.08,24.64 U6.39
PE9: length 27.3
  Top Layer w0.152: U6.40 16.82,24.14 13.21,27.75 13.21,31.56 5.21,39.56 2.67,39.56 1.78,40.45 H1.13
PE10: length 23.4
  Top Layer w0.152: U6.41 16.56,23.64 12.57,27.63 12.57,30.93 5.21,38.29 H1.16
PE11: length 26.1
  Top Layer w0.152: U6.42 16.17,23.14 11.94,27.37 11.94,30.55 5.46,37.02 3.05,37.02 H1.15
PE12: length 22.1
  Top Layer w0.152: U6.43 15.78,22.64 11.3,27.12 11.3,29.15 4.7,35.75 H1.18
PE13: length 24.7
  Top Layer w0.152: U6.44 15.39,22.14 10.67,26.86 10.67,28.77 4.95,34.48 3.05,34.48 H1.17
$1N17010: length 4.5
  Top Layer w0.254: BT1.1 48.56,37.96 44.63,37.96 D1.2
$1N17307: length 17.5
  Top Layer w0.152: 20,44.89 20,41.55 20.1,41.46 ; X2.2 19.36,41.04 20.07,40.33 21.08,40.33 27.3,34.1 U6.13
$1N17325: length 12.2
  Top Layer w0.152: 24.15,44.9 24.15,41.65 24.18,41.62 ; X2.1 26.5,35.67 27.8,34.37 U6.12
$1N17660: length 12.3
  Top Layer w0.152: C5.2 34.61,40.64 34.8,40.46 34.8,39.31 29.3,33.82 U6.9
$1N17667: length 12.7
  Top Layer w0.152: C3.2 36.88,40.63 29.8,33.56 U6.8
$1N19212: length 13.1
  Top Layer w0.152: 86.86,56.28 86.86,55.15 86.65,54.94 85.86,54.94 ; 85.86,54.94 85.86,54.94 83.31,52.39 80.7,52.39 78.35,50.04 ; 85.86,54.94 85.86,56.28
$1N19218: length 16.8
  Top Layer w0.152: 74.53,49.98 74.55,49.98 77.6,53.03 82.8,53.03 85.36,55.58 85.36,57.19 85.51,57.34 86.23,57.34 86.36,57.22 86.36,56.28
$1N20370: length 5.4
  Top Layer w0.152: 48.69,22.55 48.69,22.85 48.89,23.05 51.43,23.05 52.08,22.41 U1.6
$1N22193: length 3.2
  Top Layer w0.152: Q1.1 48.83,10.54 49.66,11.37 49.66,12.31 R13.1
$1N22195: length 6.8
  Top Layer w0.254: Q1.3 55.79,9.59 56.39,9
$1N22473: length 22.5
  Top Layer w0.254: LCD1.11 68.29,28 R21.1
$1N22574: length 1.9
  Top Layer w0.254: R19.2 61.08,26.14 Q2.1
$1N24327: length 12.4
  Top Layer w0.152: R9.1 42.42,50.02 42.42,52.39 44.83,54.8 44.83,59.34 46.24,60.74
$1N24330: length 12.4
  Top Layer w0.152: 48.71,60.65 47.5,59.43 47.5,55.19 44.58,52.26 R10.2
$1N25907: length 62.4
  Top Layer w0.152: U6.21 23.3,29.91 23.68,29.53 31.75,29.53 34.9,32.68 46.08,32.68 51.05,37.66 66.55,37.66 C13.1 74.67,45.78 U2.2
$1N28242: length 3.7
  Top Layer w0.152: U6.49 16.61,19.64 16.46,19.79 16.46,20.13
$1N28245: length 3.9
  Top Layer w0.152: C9.2 32.3,15.69 U6.73
$1N33732: length 3.6
  Top Layer w0.254: R21.2 62.98,24.19 Q2.3
$1N33743: length 2.4
  Top Layer w0.152: LED5.1 R18.2
$1N42121: length 8.2
  Top Layer w0.152: 13,60.5 13.2,60.5 16.53,57.17 R3.2
$1N45969: length 4.9
  Top Layer w0.152: 28.72,52.22 28.7,52.2 28.7,51.25 26.92,49.47 LED1.1
$1N45974: length 9.1
  Top Layer w0.152: RN1.2 27.92,51.61 26.8,50.49 21.36,50.49 LED2.1
$1N45979: length 13.1
  Top Layer w0.152: RN1.1 25.77,50.87 16.6,50.87 LED3.1
$1N45986: length 3.2
  Top Layer w0.152: RN1.4 29.52,50.68 30.63,49.57 LED0.1
$1N54805: length 13.3
  Top Layer w1.016: 57.96,56.83 59.73,55.06 66.04,55.06 67.31,56.33 F1.1
$1N62284: length 11.1
  Top Layer w0.152: 12.49,62.01 13.24,62.01 18.64,56.61 R7.2
$1N62288: length 5.4
  Top Layer w0.152: 13.3,58.82 14.41,57.7 R2.2

## Copper pours and planes (outline as drawn; the poured copper is in the pictures)
GND on Top Layer: -9.58,70.93 108.46,70.93 108.46,-4.74 -9.58,-4.74
GND on Bottom Layer: -4.63,66.98 103.08,66.98 103.08,-1.45 -4.63,-1.45

Small or netless copper shapes (teardrops, artwork), in the pictures only: 437 on Top Layer, 104 on Bottom Layer

## Text on the board
Bottom Silkscreen Layer: BOOT | 0 1 | 1 | 0 | BOOT0 | x | BOOT1 | 0  1 | 输入电压：5V | 版本号：20230921.2.2 | 型号：STM32F407VET6 | 学生电子爱好者协会 | 用户闪存启动 | 内置SRAM启动 | 系统存储器启动 | 启动模式 | ADC-PA6 | X0-PD12 X1-PD11 X2-PD10 | Y0-PD15 Y1-PD14 Y2-PD13 | 蜂鸣器-PD3 | RGB: R-PA7 G-PB0 B-PB1 | KEY0-PD0  KEY1-PA15 KEY2-PA8 | DS18B20: PC13 | LED0-3  PC0-3 | STM32F407VET6开发板 | 部分引脚定义：
Top Solder Mask Layer: ICEC
Top Silkscreen Layer: PB13 | PB15 | PA10 | 5V | 3V3 | GND | PA1 | PA3 | PA5 | PE9 | PE11 | PE13 | PB11 | PD9 | PC7 | PA0 | PA2 | PA4 | PE8 | PE10 | PE12 | PB10 | PB12 | PA14 | PD8 | PC6 | PA9 | Y0 | Y1 | Y2 | X0 | X1 | X2 | JLCJLCJLCJLC | SWITCH | RGB | DS18B20 | BOOT | PWLINK | ADC | USB | RST | LCD1.14 | TF-CARD | KEY0 | KEY1 | KEY2
